# Altium schematic sheet BUS_IF.SchDoc
size A4; SheetNumber: 7; SheetTotal: 9
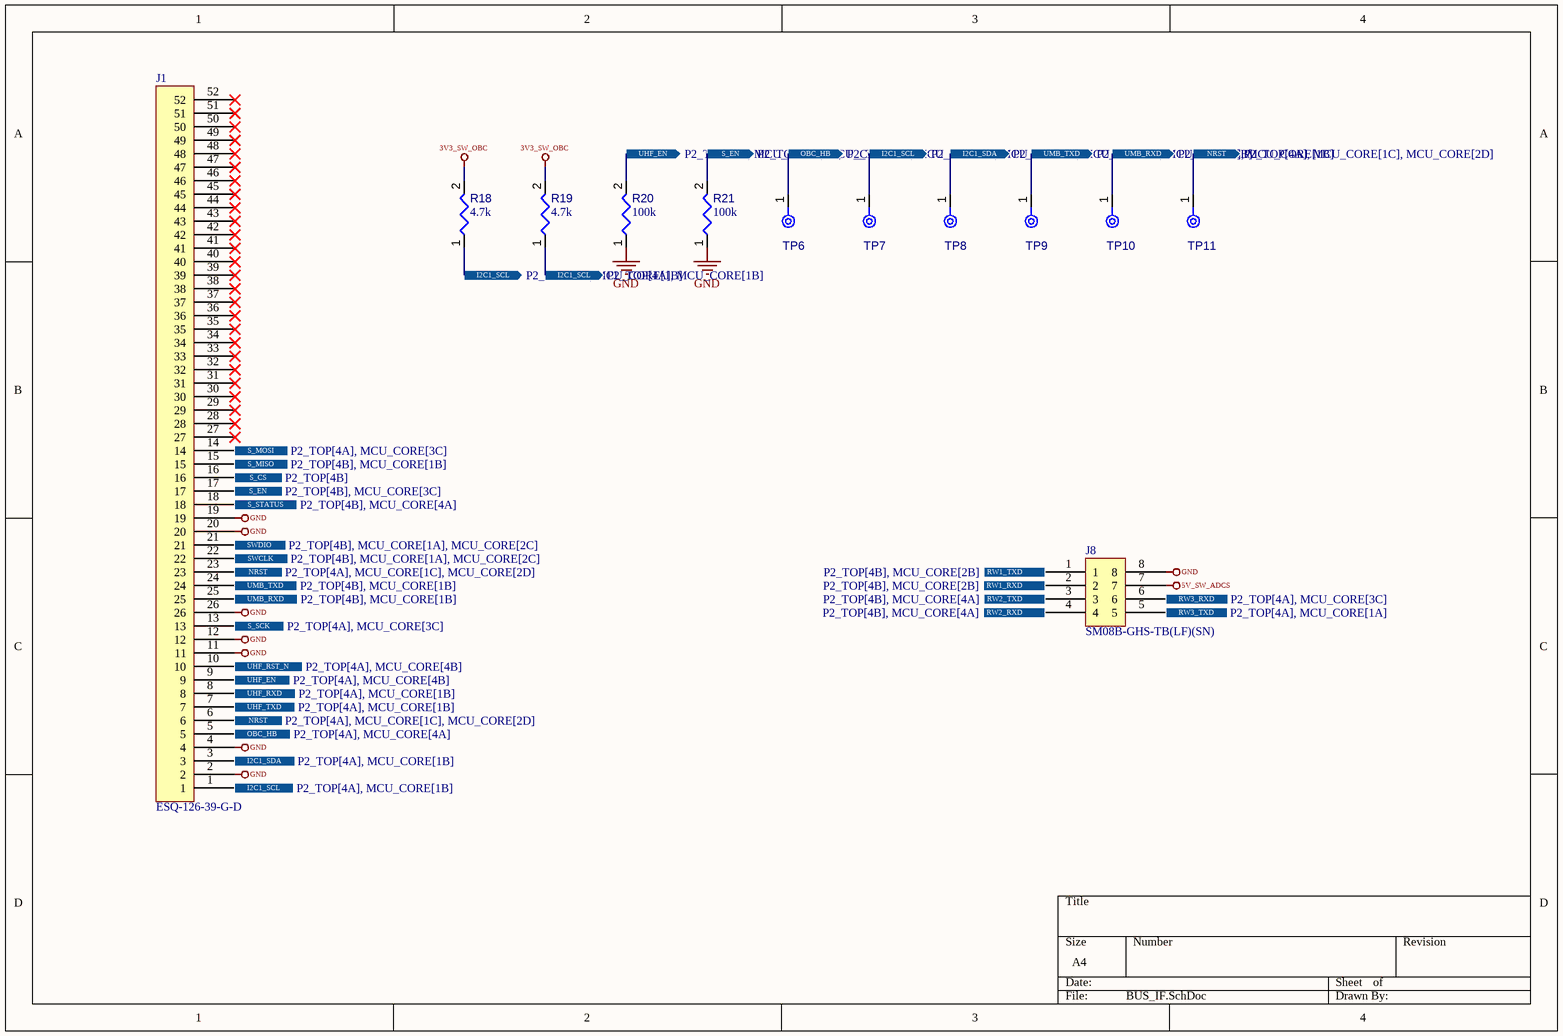
[diagram p0: BUS_IF.SchDoc]

## Parts
J1  ESQ-126-39-G-D  [CONN_ESQ-126-39-G-D_SAI]
J8  SM08B-GHS-TB(LF)(SN)
R18  value 4.7k  [RESC0402(1005)_L]  (hidden comment: Resistor 4K7  +/-1 % 0402 63 mW)
R19  value 4.7k  [RESC0402(1005)_L]  (hidden comment: Resistor 4K7  +/-1 % 0402 63 mW)
R20  value 100k  [RESC0402(1005)_L]  (hidden comment: 100KR2F)
R21  value 100k  [RESC0402(1005)_L]  (hidden comment: 100KR2F)
TP6  TPAD6R  [TP06R]  (value not drawn)  (no BOM)
TP7  TPAD6R  [TP06R]  (value not drawn)  (no BOM)
TP8  TPAD6R  [TP06R]  (value not drawn)  (no BOM)
TP9  TPAD6R  [TP06R]  (value not drawn)  (no BOM)
TP10  TPAD6R  [TP06R]  (value not drawn)  (no BOM)
TP11  TPAD6R  [TP06R]  (value not drawn)  (no BOM)

## Ports
I2C1_SCL (out, see P2_TOP[4A], MCU_CORE[1B]), I2C1_SDA (out, see P2_TOP[4A], MCU_CORE[1B]), NRST (out, see P2_TOP[4A], MCU_CORE[1C], MCU_CORE[2D]), OBC_HB (out, see P2_TOP[4A], MCU_CORE[4A]), RW1_RXD (out, see P2_TOP[4B], MCU_CORE[2B]), RW1_TXD (out, see P2_TOP[4B], MCU_CORE[2B]), RW2_RXD (out, see P2_TOP[4B], MCU_CORE[4A]), RW2_TXD (out, see P2_TOP[4B], MCU_CORE[4A]), RW3_RXD (out, see P2_TOP[4A], MCU_CORE[3C]), RW3_TXD (out, see P2_TOP[4A], MCU_CORE[1A]), S_CS (out, see P2_TOP[4B]), S_EN (out, see P2_TOP[4B], MCU_CORE[3C]), S_MISO (out, see P2_TOP[4B], MCU_CORE[1B]), S_MOSI (out, see P2_TOP[4A], MCU_CORE[3C]), S_SCK (out, see P2_TOP[4A], MCU_CORE[3C]), S_STATUS (out, see P2_TOP[4B], MCU_CORE[4A]), SWCLK (out, see P2_TOP[4B], MCU_CORE[1A], MCU_CORE[2C]), SWDIO (out, see P2_TOP[4B], MCU_CORE[1A], MCU_CORE[2C]), UHF_EN (out, see P2_TOP[4A], MCU_CORE[4B]), UHF_RST_N (out, see P2_TOP[4A], MCU_CORE[4B]), UHF_RXD (out, see P2_TOP[4A], MCU_CORE[1B]), UHF_TXD (out, see P2_TOP[4A], MCU_CORE[1B]), UMB_RXD (out, see P2_TOP[4B], MCU_CORE[1B]), UMB_TXD (out, see P2_TOP[4B], MCU_CORE[1B])

## Nets
3V3_SW_OBC: R18.2 R19.2
5V_SW_ADCS: J8.7
GND: J1.2 J1.4 J1.11 J1.12 J1.19 J1.20 J1.26 J8.8 R20.1 R21.1
I2C1_SCL: J1.1 R18.1 R19.1 TP7.1(TP) ; port I2C1_SCL
I2C1_SDA: J1.3 TP8.1(TP) ; port I2C1_SDA
NRST: J1.6 J1.23 TP11.1(TP) ; port NRST
OBC_HB: J1.5 TP6.1(TP) ; port OBC_HB
RW1_RXD: J8.2 ; port RW1_RXD
RW1_TXD: J8.1 ; port RW1_TXD
RW2_RXD: J8.4 ; port RW2_RXD
RW2_TXD: J8.3 ; port RW2_TXD
RW3_RXD: J8.6 ; port RW3_RXD
RW3_TXD: J8.5 ; port RW3_TXD
S_CS: J1.16 ; port S_CS
S_EN: J1.17 R21.2 ; port S_EN
S_MISO: J1.15 ; port S_MISO
S_MOSI: J1.14 ; port S_MOSI
S_SCK: J1.13 ; port S_SCK
S_STATUS: J1.18 ; port S_STATUS
SWCLK: J1.22 ; port SWCLK
SWDIO: J1.21 ; port SWDIO
UHF_EN: J1.9 R20.2 ; port UHF_EN
UHF_RST_N: J1.10 ; port UHF_RST_N
UHF_RXD: J1.8 ; port UHF_RXD
UHF_TXD: J1.7 ; port UHF_TXD
UMB_RXD: J1.25 TP10.1(TP) ; port UMB_RXD
UMB_TXD: J1.24 TP9.1(TP) ; port UMB_TXD

Not connected (* = marked no-connect by the designer): J1 27* 28* 29* 30* 31* 32* 33* 34* 35* 36* 37* 38* 39* 40* 41* 42* 43* 44* 45* 46* 47* 48* 49* 50* 51* 52*

## Library data of the parts
J1 = CMP-002-00077-3: Samtec ESQ Series, 2.54mm Pitch, 52-Pin Double Row Receptacle, Board-to-Board, Right Angle, TH; Manufacturer Lifecycle Status: PRODUCTION; Max Voltage Rating (AC): 550V; Contact Resistance: 10mΩ; Number of Contacts: 52; Max Current Rating: 6.9A; Housing Color: Black; Max Operating Temperature: 125°C; Depth: 4.95mm; Radiation Hardening: No; RoHS: Compliant; Housing Material: Polyester; Pitch: 2.54mm; Number of Rows: 2; Orientation: Straight; Length: 66.55mm; Lifecycle Status: Production; Packaging: Bulk; Contact Plating: Gold; Termination: Solder; Pins: 52; Min Operating Temperature: -55°C; Contact Material: Bronze
J8 = CMP-002-00081-2: Connector Header Surface Mount, Right Angle 8 position 0.049" (1.25mm); Voltage Rating: 50V; Contact Resistance: 50mΩ; Gender: Male; Number of Contacts: 8; Current Rating: 1A; Pitch: 1.2446mm; Insulation Resistance: 100MΩ; Connector Type: Male Pin, Outer Shroud Contact; Dielectric Material: Polyamide; Orientation: Right Angle; Max Operating Temperature: 85°C; Contact Material: Copper, Tin; Contact Plating: Tin; Pins: 8; Lifecycle Status: Production; Min Operating Temperature: -25°C; Number of Rows: 1; Housing Color: Natural; REACH SVHC: Unaffected; Termination: Solder; Manufacturer Package Identifier: SM08B-GHS-TB(LF)(SN); Height: 4.35mm; Housing Material: Nylon; Fastening Type: Latch, Ramp; Number of Positions: 8; RoHS: Compliant; Lead Free: Lead Free; Terminal Pitch: 1.25mm; Color: Natural; Mounting Technology: Surface Mount
R18 R19 = CMP-009-00158-3: Chip Resistor, 4,7 kOhms, +/-1 %, 63 mW, -55 to 155 degC, 0402; Power: 63mW; Tolerance: 1%; Max Operating Temperature: 155°C; Pins: 2; Min Operating Temperature: -55°C; Case/Package: 0402
R20 R21 = CMP-009-00064-2: 100K 0.063W 1% 0402 (1005 Metric)  SMD; Power: 63mW; Case/Package: 0402; Mounting Technology: SMT; Pins: 2; Tolerance: 1%
TP6-TP11 = CMP-00028-00002-2: 0.6mm round; Pins: 1